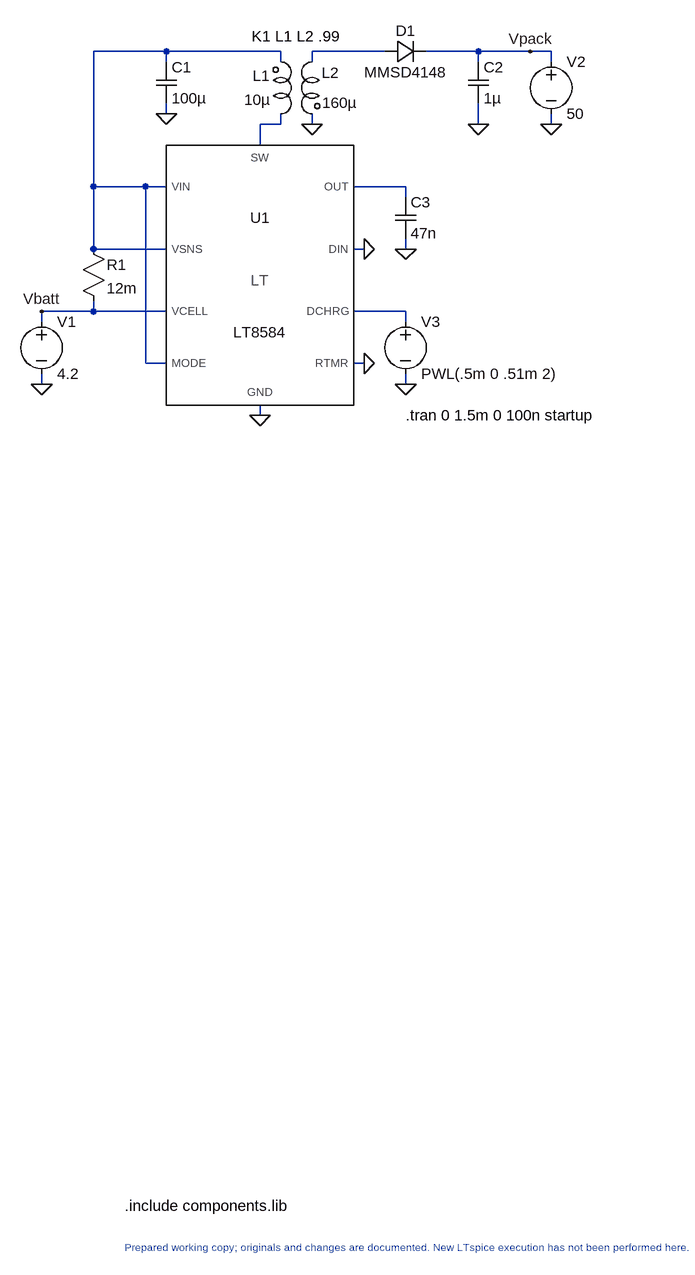
[diagram p0: schematic Model.asc]
Model.asc, the LTspice schematic file:
Version 4
SHEET 1 900 680
WIRE 96 -112 -16 -112
WIRE 272 -112 96 -112
WIRE 432 -112 320 -112
WIRE 576 -112 496 -112
WIRE 656 -112 576 -112
WIRE 688 -112 656 -112
WIRE 96 -96 96 -112
WIRE 272 -96 272 -112
WIRE 320 -96 320 -112
WIRE 576 -96 576 -112
WIRE 688 -96 688 -112
WIRE 96 -16 96 -32
WIRE 272 0 272 -16
WIRE 272 0 240 0
WIRE 320 0 320 -16
WIRE 576 0 576 -32
WIRE 688 0 688 -16
WIRE 240 32 240 0
WIRE -16 96 -16 -112
WIRE 64 96 -16 96
WIRE 96 96 64 96
WIRE 464 96 384 96
WIRE 464 112 464 96
WIRE -16 192 -16 96
WIRE 96 192 -16 192
WIRE 400 192 384 192
WIRE 464 192 464 176
WIRE -16 288 -16 272
WIRE -16 288 -96 288
WIRE 96 288 -16 288
WIRE 464 288 384 288
WIRE -96 304 -96 288
WIRE 464 304 464 288
WIRE 64 368 64 96
WIRE 96 368 64 368
WIRE 400 368 384 368
WIRE -96 400 -96 384
WIRE 464 400 464 384
WIRE 240 448 240 432
FLAG 240 448 0
FLAG -96 400 0
FLAG 96 -16 0
FLAG 320 0 0
FLAG 576 0 0
FLAG 688 0 0
FLAG 400 368 0
FLAG 400 192 0
FLAG 464 192 0
FLAG 464 400 0
FLAG -96 288 Vbatt
FLAG 656 -112 Vpack
SYMBOL voltage -96 288 R0
SYMATTR InstName V1
SYMATTR Value 4.2
SYMBOL res -32 176 R0
SYMATTR InstName R1
SYMATTR Value 12m
SYMBOL cap 80 -96 R0
SYMATTR InstName C1
SYMATTR Value 100µ
SYMATTR SpiceLine Rser=10m
SYMBOL diode 432 -128 M90
WINDOW 0 0 32 VBottom 2
WINDOW 3 32 32 VTop 2
SYMATTR InstName D1
SYMATTR Value MMSD4148
SYMBOL cap 560 -96 R0
SYMATTR InstName C2
SYMATTR Value 1µ
SYMBOL voltage 688 -112 R0
SYMATTR InstName V2
SYMATTR Value 50
SYMBOL cap 448 112 R0
SYMATTR InstName C3
SYMATTR Value 47n
SYMBOL voltage 464 288 R0
WINDOW 123 0 0 Left 2
WINDOW 39 0 0 Left 2
SYMATTR InstName V3
SYMATTR Value PWL(.5m 0 .51m 2)
SYMBOL ind2 256 0 M180
WINDOW 0 0 75 Right 2
WINDOW 3 0 38 Right 2
SYMATTR InstName L1
SYMATTR Value 10µ
SYMATTR Type ind
SYMATTR SpiceLine Rser=10m Rpar=5K
SYMBOL ind2 336 -112 M0
WINDOW 0 1 33 Right 2
WINDOW 3 0 79 Right 2
SYMATTR InstName L2
SYMATTR Value 160µ
SYMATTR Type ind
SYMATTR SpiceLine Rser=.1 Rpar=2K
SYMBOL LT8584 240 240 R0
SYMATTR InstName U1
TEXT 296 -120 Bottom 2 !K1 L1 L2 .99
TEXT 464 448 Left 2 !.tran 0 1.5m 0 100n startup
TEXT 32 1664 Left 2 !.include components.lib
TEXT 32 1728 Left 1 ;Prepared working copy; originals and changes are documented. New LTspice execution has not been performed here.

The netlist it stands for:
* Model.asc
V1 Vbatt 0 4.2
R1 N001 Vbatt 12m
C1 N001 0 100µ Rser=10m
D1 N002 Vpack MMSD4148
C2 Vpack 0 1µ
V2 Vpack 0 50
C3 N004 0 47n
V3 N005 0 PWL(.5m 0 .51m 2)
L1 N003 N001 10µ Rser=10m Rpar=5K
L2 N002 0 160µ Rser=.1 Rpar=2K
XU1 0 N003 N005 N001 N001 0 0 N004 N001 Vbatt LT8584  ; pins GND SW DCHRG VSNS MODE RTMR DIN OUT VIN VCELL
.model D D
.lib standard.dio
K1 L1 L2 .99
.tran 0 1.5m 0 100n startup
.include components.lib
* Prepared working copy; originals and changes are documented. New LTspice execution has not been performed here.
.lib LT8584.sub
.backanno
.end